# Altium schematic sheet Charger.SchDoc
size B; SheetNumber: 3; SheetTotal: 7
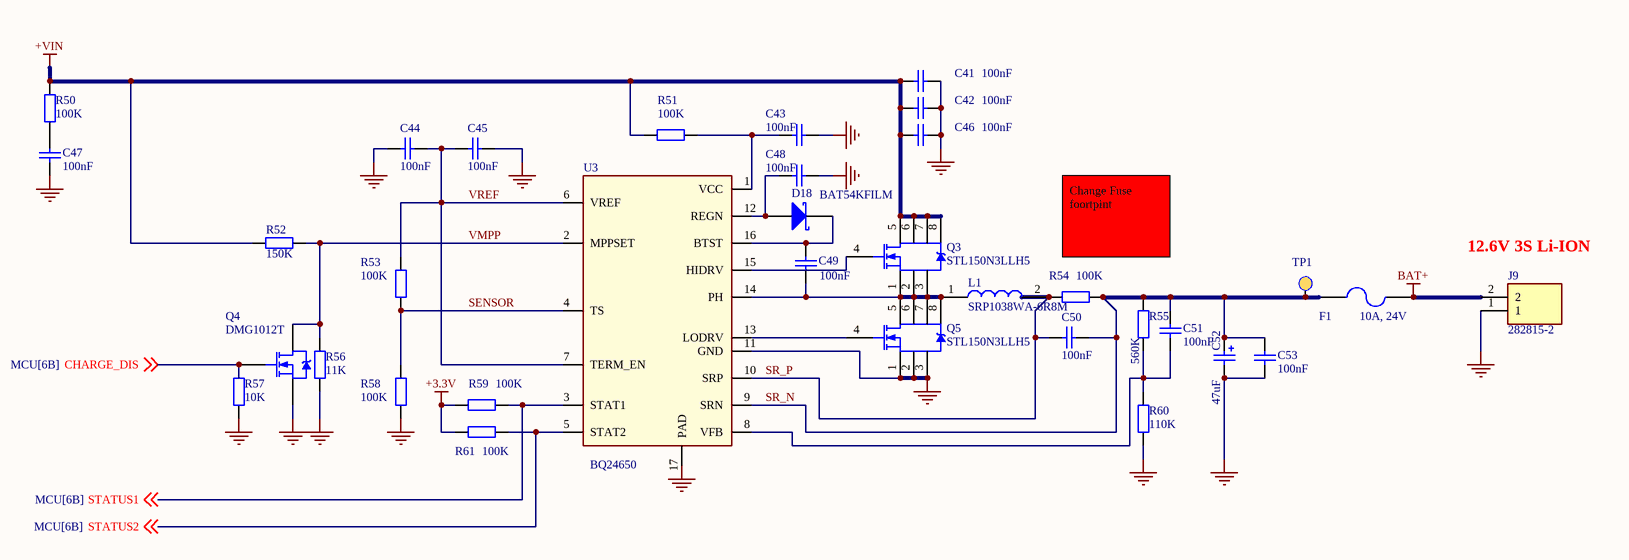
[diagram p0: Charger.SchDoc]

## Parts
C41  value 100nF  [C0402]  (hidden comment: Capacitor ceramic)
C42  value 100nF  [C0402]  (hidden comment: Capacitor ceramic)
C43  value 100nF  [C0402]  (hidden comment: Capacitor ceramic)
C44  value 100nF  [C0402]  (hidden comment: Capacitor ceramic)
C45  value 100nF  [C0402]  (hidden comment: Capacitor ceramic)
C46  value 100nF  [C0402]  (hidden comment: Capacitor ceramic)
C47  value 100nF  [C0402]  (hidden comment: Capacitor ceramic)
C48  value 100nF  [C0402]  (hidden comment: Capacitor ceramic)
C49  value 100nF  [C0402]  (hidden comment: Capacitor ceramic)
C50  value 100nF  [C0402]  (hidden comment: Capacitor ceramic)
C51  value 100nF  [C0402]  (hidden comment: Capacitor ceramic)
C52  value 47uF  [EIA-7343-31]  (hidden comment: Capacitor Tantalum)
C53  value 100nF  [C0402]  (hidden comment: Capacitor ceramic)
D18  BAT54KFILM  [SOD-523]
F1  10A, 24V  [F1206]
J9  282815-2  [SHDRRA2W102P0X508_1X2_1016X1200X850P]
L1  SRP1038WA-6R8M  [SRP1038WA6R8M]
Q3  STL150N3LLH5  [PowerFLAT 5x6]
Q4  DMG1012T  [SOT-523_custom]
Q5  STL150N3LLH5  [PowerFLAT 5x6]
R50  value 100K  [R0402]  (hidden comment: Resistor)
R51  value 100K  [R0402]  (hidden comment: Resistor)
R52  value 150K  [R0402]  (hidden comment: Resistor)
R53  value 100K  [R0402]  (hidden comment: Resistor)
R54  value 100K  [F1206]  (hidden comment: Resistor)
R55  value 560K  [R0402]  (hidden comment: Resistor)
R56  value 11K  [R0402]  (hidden comment: Resistor)
R57  value 10K  [R0402]  (hidden comment: Resistor)
R58  value 100K  [R0402]  (hidden comment: Resistor)
R59  value 100K  [R0402]  (hidden comment: Resistor)
R60  value 110K  [R0402]  (hidden comment: Resistor)
R61  value 100K  [R0402]  (hidden comment: Resistor)
TP1  Test_Point  [TEST_POINT]  (value not drawn)  (no BOM)
U3  BQ24650  [QFN-16_custom]

## Nets
+3.3V: R59.1 R61.1
+VIN: C41.2 C42.2 C46.2 Q3.5(D) Q3.6(D) Q3.7(D) Q3.8(D) R50.2 R51.1 R52.2
BAT+: F1.2 J9.2
GND: C41.1 C42.1 C43.1 C44.1 C45.1 C46.1 C47.2 C48.1 C52.2 C53.2 J9.1 Q4.3(S) Q5.1(S) Q5.2(S) Q5.3(S) R56.1 R57.1 R58.1 R60.1 U3.11(GND) U3.17(PAD)
CHARGE_DIS: Q4.1(G) R57.2 ; off-sheet CHARGE_DIS
SENSOR: R53.1 R58.2 U3.4(TS)
SR_N: C50.1 C51.1 C52.1 C53.1 F1.1 R54.2 R55.2 TP1.0 U3.9(SRN)
SR_P: C50.2 L1.2 R54.1 U3.10(SRP)
STATUS1: R59.2 U3.3(STAT1) ; off-sheet STATUS1
STATUS2: R61.2 U3.5(STAT2) ; off-sheet STATUS2
VMPP: Q4.2(D) R52.1 R56.2 U3.2(MPPSET)
VREF: C44.2 C45.2 R53.2 U3.6(VREF) U3.7(TERM_EN)
NetC43_2: C43.2 R51.2 U3.1(VCC)
NetC47_1: C47.1 R50.1
NetC48_2: C48.2 D18.1(A) U3.12(REGN)
NetC49_1: C49.1 D18.2(K) U3.16(BTST)
NetC49_2: C49.2 L1.1 Q3.1(S) Q3.2(S) Q3.3(S) Q5.5(D) Q5.6(D) Q5.7(D) Q5.8(D) U3.14(PH)
NetC51_2: C51.2 R55.1 R60.2 U3.8(VFB)
NetQ3_4: Q3.4(G) U3.15(HIDRV)
NetQ5_4: Q5.4(G) U3.13(LODRV)

## Notes on the sheet
- Change Fuse foortpint
- (near J9) 12.6V 3S Li-ION

## Library data of the parts
C41-C51 C53 = Cap: Manufacturer: TDK Corporation; Manufacturer Part No.: CGA2B3X7R1V104K050BB; Part Description: Ceramic Capacitor; Specification: X7R, 35V, 10%; Link: https://www.digikey.com/product-detail/en/tdk-corporation/CGA2B3X7R1V104K050BB/445-6901-1-ND/2672919; Supplier: DigiKey; Supplier part number: 445-6901-1-ND
C52 = Cap Pol2: Manufacturer: AVX Corporation; Manufacturer Part No.: TAJD476K016RNJ; Specification: TANT, 16V, 10%; Link: https://www.digikey.com/product-detail/en/avx-corporation/TAJD476K016RNJ/478-1739-1-ND/564771; Part Description: Capacitor Tantalum; Supplier: DigiKey; Supplier part number: 478-1739-1-ND
D18 = D Schottky: Schottky Diode; Manufacturer: STMicroelectronics; Part Description: Small signal Schottky diode; Specification: 40V, 0.3A; Manufacturer Part No.: BAT54KFILM; Supplier: DigiKey; Supplier part number: 497-5561-1-ND; Value: BAT54KFILM; Link: https://www.digikey.com/product-detail/en/stmicroelectronics/BAT54KFILM/497-5561-1-ND/1207053
F1 = Fuse 2: SMD Fuse; Manufacturer: LITTELFUSE; Part Description: Fast Acting  Fuse; Value: 1206SFH100F/24-2; Specification: 100A; Link: https://uk.farnell.com/littelfuse/1206sfh100f-24-2/fuse-1206-10a/dp/1832124; Manufacturer Part No.: 1206SFH100F/24-2; Supplier: Farnell; Supplier part number: 1832124
J9 = 282815-2: Connector; Manufacturer_Name: TE Connectivity; Datasheet Link: https://www.te.com/commerce/DocumentDelivery/DDEController?Action=srchrtrv&DocNm=1-773958-1&DocType=Data%20Sheet&DocLang=English&PartCntxt=282815-2&DocFormat=pdf; Height: 8.5mm; Manufacturer_Part_Number: 282815-2; Mouser Part Number: 571-282815-2; Mouser Price/Stock: https://www.mouser.co.uk/ProductDetail/TE-Connectivity/282815-2?qs=79%2FjLZ2kXkpF7MFURi982A%3D%3D; Arrow Part Number: 282815-2; Arrow Price/Stock: https://www.arrow.com/en/products/282815-2/te-connectivity?region=nac
L1 = SRP1038WA-6R8M: Inductor; Manufacturer_Name: Bourns; Datasheet Link: http://www.bourns.com/docs/Product-Datasheets/SRP1038WA.pdf; Height: 4mm; Manufacturer_Part_Number: SRP1038WA-6R8M; Mouser Part Number: 652-SRP1038WA-6R8M; Mouser Price/Stock: https://www.mouser.co.uk/ProductDetail/Bourns/SRP1038WA-6R8M?qs=Li%252BoUPsLEnvjAfZ1C4lLZQ%3D%3D
Q3 Q5 = STL150N3LLH5: Power MOSFET N-channel; Manufacturer: STMicroelectronics; Part Description: P-channel Power MOSFET; Specification: 30V, 35A; Manufacturer Part No.: STL150N3LLH5; Supplier: Farnell; Supplier part number: 1752112RL; Value: STL150N3LLH5; Link: https://uk.farnell.com/stmicroelectronics/stl150n3llh5/mosfet-n-ch-30v-35a-powerflat6x5/dp/1752112RL
Q4 = NMOS-2: N-Channel Power MOSFET; Manufacturer: Diodes Incorporated; Manufacturer Part No.: DMG1012T-7; Part Description: N-Channel MOSFET; Specification: 20V, 0.63A; Value: DMG1012T-7; Supplier: DigiKey; Supplier part number: DMG1012T-7DICT-ND; Link: https://www.digikey.com/product-detail/en/diodes-incorporated/DMG1012T-7/DMG1012T-7DICT-ND/2181232
R50 R51 R53 R54 R58 R59 R61 = Res2: Manufacturer: Yageo; Manufacturer Part No.: RC0402JR-07100KL; Part Description: Thick Film Resistor; Specification: 5% 0,063W; Link: https://www.digikey.com/product-detail/en/yageo/RC0402JR-07100KL/311-100KJRCT-ND/729363; Supplier: DigiKey; Supplier part number: 311-100KJRCT-ND
R52 = Res2: Manufacturer: Yageo; Manufacturer Part No.: RC0402JR-07150KL; Part Description: Thick Film Resistor; Specification: 5% 0,063W; Link: https://www.digikey.com/product-detail/en/yageo/RC0402JR-07150KL/311-150KJRCT-ND/729372; Supplier: DigiKey; Supplier part number: 311-150KJRCT-ND
R55 = Res2: Manufacturer: Yageo; Manufacturer Part No.: RC0402JR-07560KL; Part Description: Thick Film Resistor; Specification: 5% 0,063W; Link: https://www.digikey.com/product-detail/en/yageo/RC0402JR-07560KL/311-560KJRCT-ND/729440; Supplier: DigiKey; Supplier part number: 311-560KJRCT-ND
R56 = Res2: Manufacturer: Yageo; Manufacturer Part No.: RC0402JR-0711KL; Part Description: Thick Film Resistor; Specification: 5% 0,063W; Link: https://www.digikey.com/product-detail/en/yageo/RC0402JR-0711KL/311-11KJRCT-ND/729367; Supplier: DigiKey; Supplier part number: 311-11KJRCT-ND
R57 = Res2: Manufacturer: Yageo; Manufacturer Part No.: RC0100JR-0710KL; Part Description: Thick Film Resistor; Specification: 5% 0.03W; Link: https://www.digikey.com/product-detail/en/yageo/RC0100JR-0710KL/311-10KDHCT-ND/2254412; Supplier: DigiKey; Supplier part number: 311-10KDHCT-ND
R60 = Res2: Manufacturer: Yageo; Manufacturer Part No.: RC0402JR-07110KL; Part Description: Thick Film Resistor; Specification: 5% 0,063W; Link: https://www.digikey.com/product-detail/en/yageo/RC0402JR-07110KL/311-110KJRCT-ND/729366; Supplier: DigiKey; Supplier part number: 311-110KJRCT-ND
TP1 = Test_Point: Test Point
U3 = BQ24650: Maximum Power Point Charger; Manufacturer: TI; Manufacturer Part No.: BQ24650RVAR; Part Description: Battery Charge Controller; Value: BQ24650RVAT; Specification: 28V, MPPT; Link: https://www.digikey.com/product-detail/en/texas-instruments/BQ24650RVAR/296-46287-1-ND/7033462; Supplier: DigiKey; Supplier part number: 296-46287-1-ND